# Altium schematic sheet 20_MCU_CORE.SchDoc
size 297 x 209 mm
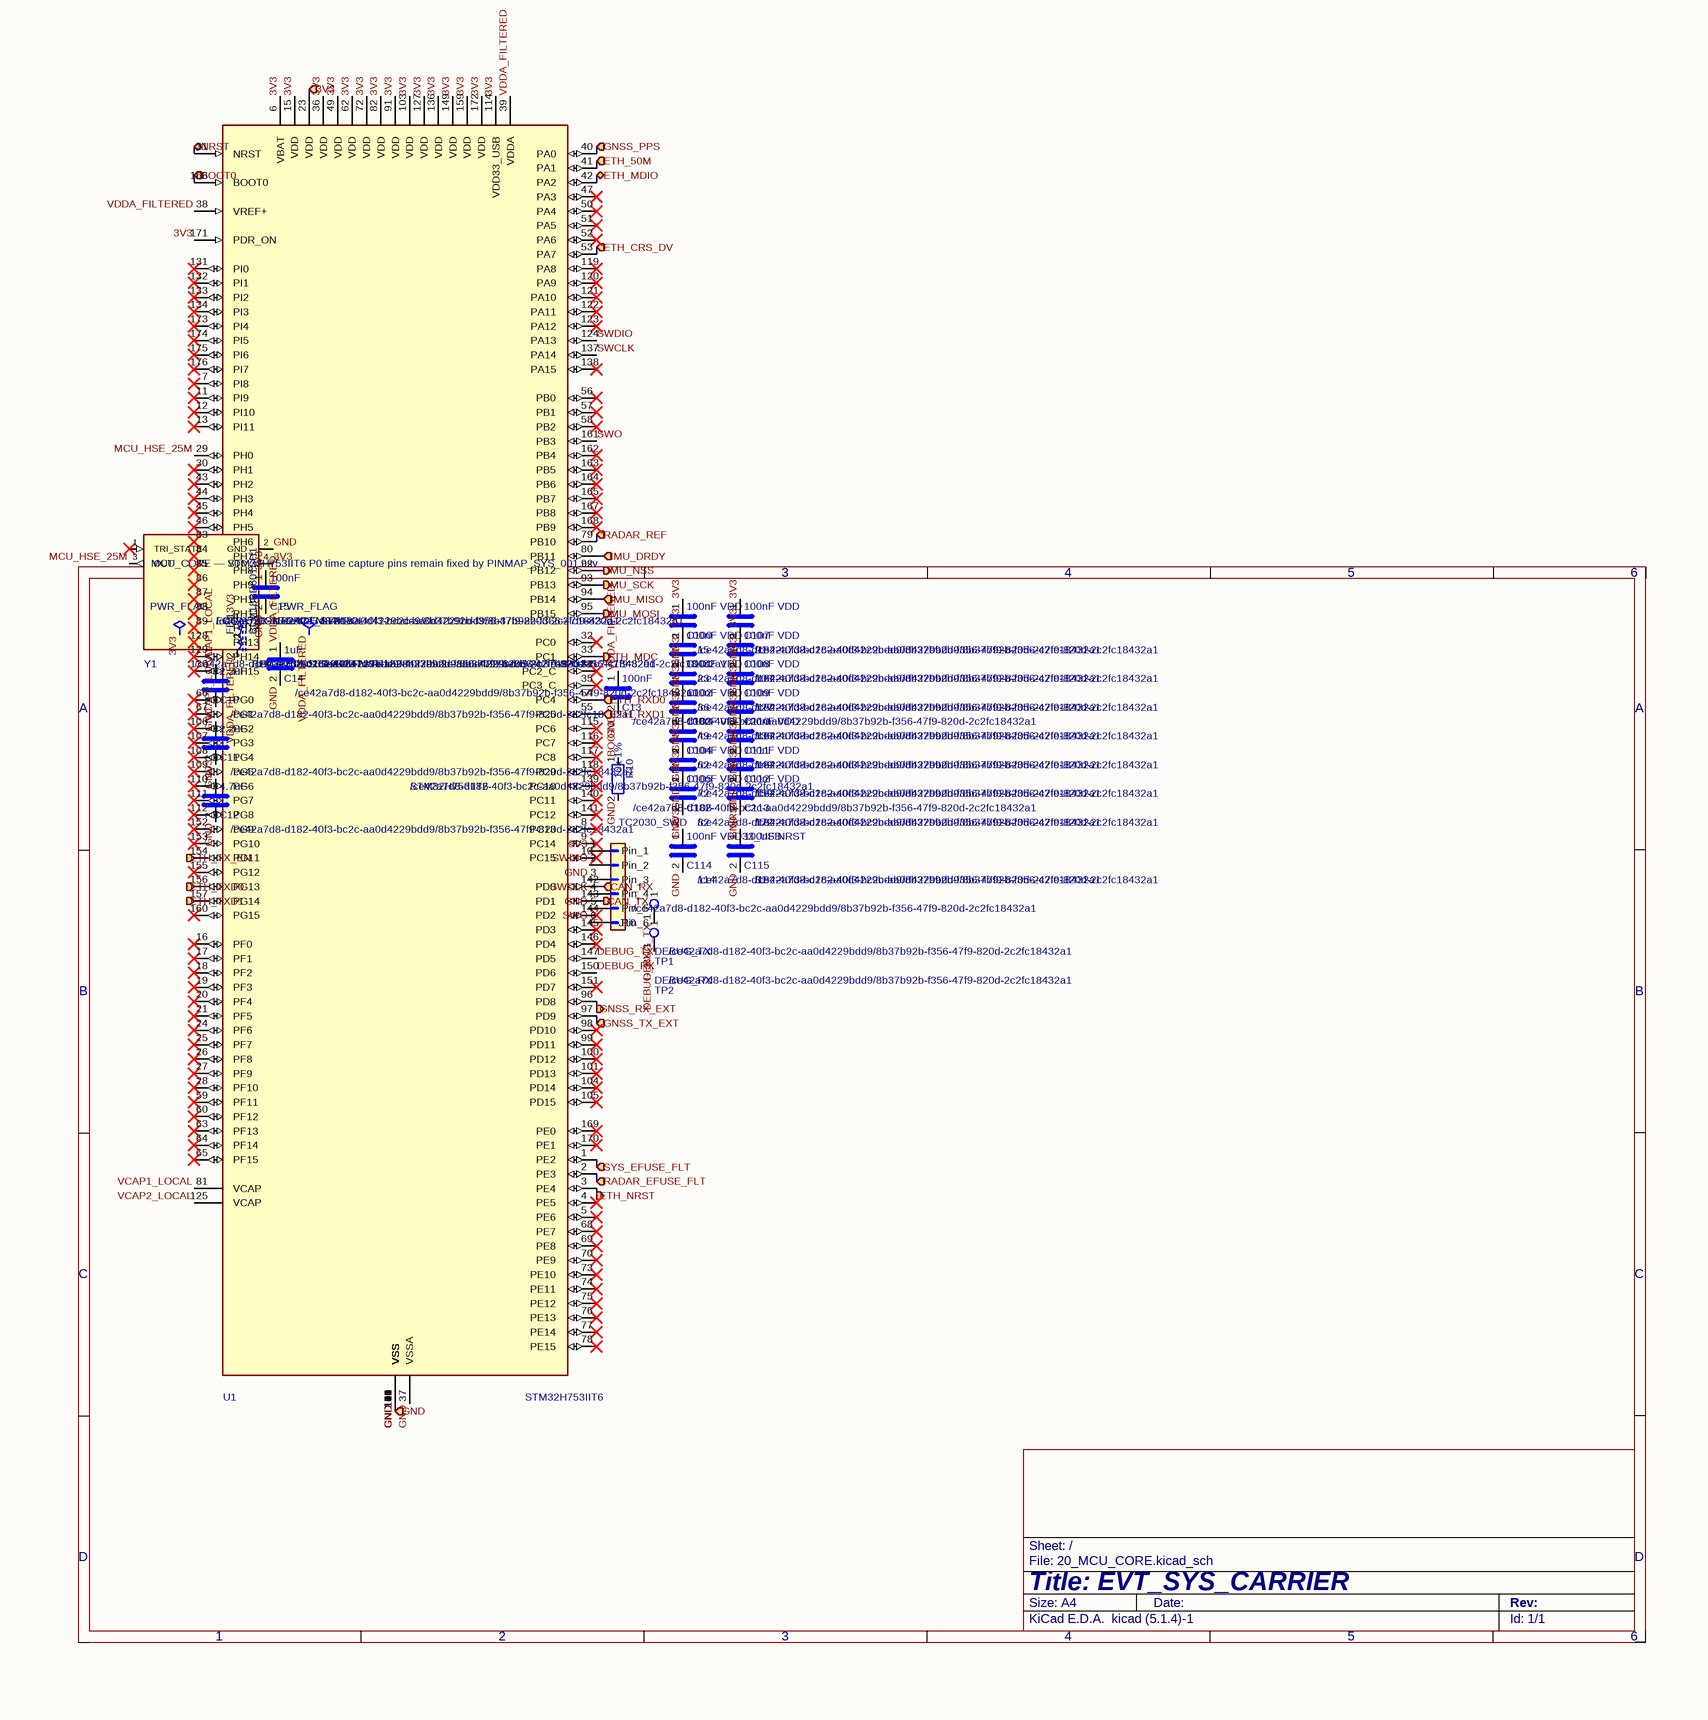
[diagram p0: 20_MCU_CORE.SchDoc]

## Parts
#FLG0101  hierarchy_path: /ce42a7d8-d182-40f3-bc2c-aa0d4229bdd9/8b37b92b-f356-47f9-820d-2c2fc18432a1  (hidden comment: PWR_FLAG)  (graphical)
#FLG0103  hierarchy_path: /ce42a7d8-d182-40f3-bc2c-aa0d4229bdd9/8b37b92b-f356-47f9-820d-2c2fc18432a1  (hidden comment: PWR_FLAG)  (graphical)
C10  hierarchy_path: /ce42a7d8-d182-40f3-bc2c-aa0d4229bdd9/8b37b92b-f356-47f9-820d-2c2fc18432a1  [C_0603_1608Metric]  (hidden comment: 2.2uF)
C11  hierarchy_path: /ce42a7d8-d182-40f3-bc2c-aa0d4229bdd9/8b37b92b-f356-47f9-820d-2c2fc18432a1  [C_0603_1608Metric]  (hidden comment: 2.2uF)
C12  hierarchy_path: /ce42a7d8-d182-40f3-bc2c-aa0d4229bdd9/8b37b92b-f356-47f9-820d-2c2fc18432a1  [C_0805_2012Metric]  (hidden comment: 4.7uF)
C13  hierarchy_path: /ce42a7d8-d182-40f3-bc2c-aa0d4229bdd9/8b37b92b-f356-47f9-820d-2c2fc18432a1  [C_0402_1005Metric]  (hidden comment: 100nF)
C14  hierarchy_path: /ce42a7d8-d182-40f3-bc2c-aa0d4229bdd9/8b37b92b-f356-47f9-820d-2c2fc18432a1  [C_0603_1608Metric]  (hidden comment: 1uF)
C15  hierarchy_path: /ce42a7d8-d182-40f3-bc2c-aa0d4229bdd9/8b37b92b-f356-47f9-820d-2c2fc18432a1  [C_0402_1005Metric]  (hidden comment: 100nF)
C100  Decouples_U1_Pin: 15  hierarchy_path: /ce42a7d8-d182-40f3-bc2c-aa0d4229bdd9/8b37b92b-f356-47f9-820d-2c2fc18432a1  [C_0402_1005Metric]  (hidden comment: 100nF VDD)
C101  Decouples_U1_Pin: 23  hierarchy_path: /ce42a7d8-d182-40f3-bc2c-aa0d4229bdd9/8b37b92b-f356-47f9-820d-2c2fc18432a1  [C_0402_1005Metric]  (hidden comment: 100nF VDD)
C102  Decouples_U1_Pin: 36  hierarchy_path: /ce42a7d8-d182-40f3-bc2c-aa0d4229bdd9/8b37b92b-f356-47f9-820d-2c2fc18432a1  [C_0402_1005Metric]  (hidden comment: 100nF VDD)
C103  Decouples_U1_Pin: 49  hierarchy_path: /ce42a7d8-d182-40f3-bc2c-aa0d4229bdd9/8b37b92b-f356-47f9-820d-2c2fc18432a1  [C_0402_1005Metric]  (hidden comment: 100nF VDD)
C104  Decouples_U1_Pin: 62  hierarchy_path: /ce42a7d8-d182-40f3-bc2c-aa0d4229bdd9/8b37b92b-f356-47f9-820d-2c2fc18432a1  [C_0402_1005Metric]  (hidden comment: 100nF VDD)
C105  Decouples_U1_Pin: 72  hierarchy_path: /ce42a7d8-d182-40f3-bc2c-aa0d4229bdd9/8b37b92b-f356-47f9-820d-2c2fc18432a1  [C_0402_1005Metric]  (hidden comment: 100nF VDD)
C106  Decouples_U1_Pin: 82  hierarchy_path: /ce42a7d8-d182-40f3-bc2c-aa0d4229bdd9/8b37b92b-f356-47f9-820d-2c2fc18432a1  [C_0402_1005Metric]  (hidden comment: 100nF VDD)
C107  Decouples_U1_Pin: 91  hierarchy_path: /ce42a7d8-d182-40f3-bc2c-aa0d4229bdd9/8b37b92b-f356-47f9-820d-2c2fc18432a1  [C_0402_1005Metric]  (hidden comment: 100nF VDD)
C108  Decouples_U1_Pin: 103  hierarchy_path: /ce42a7d8-d182-40f3-bc2c-aa0d4229bdd9/8b37b92b-f356-47f9-820d-2c2fc18432a1  [C_0402_1005Metric]  (hidden comment: 100nF VDD)
C109  Decouples_U1_Pin: 127  hierarchy_path: /ce42a7d8-d182-40f3-bc2c-aa0d4229bdd9/8b37b92b-f356-47f9-820d-2c2fc18432a1  [C_0402_1005Metric]  (hidden comment: 100nF VDD)
C110  Decouples_U1_Pin: 136  hierarchy_path: /ce42a7d8-d182-40f3-bc2c-aa0d4229bdd9/8b37b92b-f356-47f9-820d-2c2fc18432a1  [C_0402_1005Metric]  (hidden comment: 100nF VDD)
C111  Decouples_U1_Pin: 149  hierarchy_path: /ce42a7d8-d182-40f3-bc2c-aa0d4229bdd9/8b37b92b-f356-47f9-820d-2c2fc18432a1  [C_0402_1005Metric]  (hidden comment: 100nF VDD)
C112  Decouples_U1_Pin: 159  hierarchy_path: /ce42a7d8-d182-40f3-bc2c-aa0d4229bdd9/8b37b92b-f356-47f9-820d-2c2fc18432a1  [C_0402_1005Metric]  (hidden comment: 100nF VDD)
C113  Decouples_U1_Pin: 172  hierarchy_path: /ce42a7d8-d182-40f3-bc2c-aa0d4229bdd9/8b37b92b-f356-47f9-820d-2c2fc18432a1  [C_0402_1005Metric]  (hidden comment: 100nF VDD)
C114  Decouples_U1_Pin: 114  hierarchy_path: /ce42a7d8-d182-40f3-bc2c-aa0d4229bdd9/8b37b92b-f356-47f9-820d-2c2fc18432a1  [C_0402_1005Metric]  (hidden comment: 100nF VDD33_USB)
C115  Filters_U1_Pin: 31  hierarchy_path: /ce42a7d8-d182-40f3-bc2c-aa0d4229bdd9/8b37b92b-f356-47f9-820d-2c2fc18432a1  [C_0402_1005Metric]  (hidden comment: 100nF NRST)
FB1  hierarchy_path: /ce42a7d8-d182-40f3-bc2c-aa0d4229bdd9/8b37b92b-f356-47f9-820d-2c2fc18432a1  [L_0603_1608Metric]  (hidden comment: BLM18BD601SH1)
J10  hierarchy_path: /ce42a7d8-d182-40f3-bc2c-aa0d4229bdd9/8b37b92b-f356-47f9-820d-2c2fc18432a1  [TagConnect_TC2030_NL]  (hidden comment: TC2030_SWD)
R10  hierarchy_path: /ce42a7d8-d182-40f3-bc2c-aa0d4229bdd9/8b37b92b-f356-47f9-820d-2c2fc18432a1  [R_0603_1608Metric]  (hidden comment: 10k 1%)
TP1  hierarchy_path: /ce42a7d8-d182-40f3-bc2c-aa0d4229bdd9/8b37b92b-f356-47f9-820d-2c2fc18432a1  [TestPoint_Pad_D1.0mm]  (hidden comment: DEBUG_TX)
TP2  hierarchy_path: /ce42a7d8-d182-40f3-bc2c-aa0d4229bdd9/8b37b92b-f356-47f9-820d-2c2fc18432a1  [TestPoint_Pad_D1.0mm]  (hidden comment: DEBUG_RX)
U1  hierarchy_path: /ce42a7d8-d182-40f3-bc2c-aa0d4229bdd9/8b37b92b-f356-47f9-820d-2c2fc18432a1  [LQFP-176_24x24mm_P0.5mm]  (hidden comment: STM32H753IIT6)
Y1  Capture_Status: LOCAL_CONTRACT_SYMBOL  hierarchy_path: /ce42a7d8-d182-40f3-bc2c-aa0d4229bdd9/8b37b92b-f356-47f9-820d-2c2fc18432a1  [Oscillator_SMD_ECS_2520MV-xxx-xx-4Pin_2.5x2.0mm]  (hidden comment: ECS-2520S33-250-FN-TR)

## Ports
3V3 (in), BOOT0 (in), CAN_RX (in), CAN_TX (out), ETH_50M (in), ETH_CRS_DV (in), ETH_MDC (out), ETH_MDIO (bidir), ETH_NRST (out), ETH_RXD0 (in), ETH_RXD1 (in), ETH_TX_EN (out), ETH_TXD0 (out), ETH_TXD1 (out), GND, GNSS_PPS (in), GNSS_RX_EXT (out), GNSS_TX_EXT (in), IMU_DRDY (in), IMU_MISO (in), IMU_MOSI (out), IMU_NSS (out), IMU_SCK (out), NRST (bidir), RADAR_EFUSE_FLT (in), RADAR_REF (in), SYS_EFUSE_FLT (in)

## Nets
3V3: #FLG0101.1 C12.1 C15.1 C100.1 C101.1 C102.1 C103.1 C104.1 C105.1 C106.1 C107.1 C108.1 C109.1 C110.1 C111.1 C112.1 C113.1 C114.1 FB1.1 J10.1(Pin_1) U1.6(VBAT) U1.15(VDD) U1.36(VDD) U1.49(VDD) U1.62(VDD) U1.72(VDD) U1.82(VDD) U1.91(VDD) U1.103(VDD) U1.114(VDD33_USB) U1.127(VDD) U1.136(VDD) U1.149(VDD) U1.159(VDD) U1.171(PDR_ON) U1.172(VDD) Y1.4(VDD)
3V3: U1.23(VDD) ; port 3V3  [a separate net that carries the same name]
BOOT0: U1.166(BOOT0) ; port BOOT0
BOOT0: R10.1  [a separate net that carries the same name]
CAN_RX: U1.142(PD0) ; port CAN_RX
CAN_TX: U1.143(PD1) ; port CAN_TX
DEBUG_RX: TP2.1 U1.150(PD6)
DEBUG_TX: TP1.1 U1.147(PD5)
ETH_50M: U1.41(PA1) ; port ETH_50M
ETH_CRS_DV: U1.53(PA7) ; port ETH_CRS_DV
ETH_MDC: U1.33(PC1) ; port ETH_MDC
ETH_MDIO: U1.42(PA2) ; port ETH_MDIO
ETH_NRST: U1.3(PE4) ; port ETH_NRST
ETH_RXD0: U1.54(PC4) ; port ETH_RXD0
ETH_RXD1: U1.55(PC5) ; port ETH_RXD1
ETH_TX_EN: U1.154(PG11) ; port ETH_TX_EN
ETH_TXD0: U1.156(PG13) ; port ETH_TXD0
ETH_TXD1: U1.157(PG14) ; port ETH_TXD1
GND: C10.2 C11.2 C12.2 C13.2 C14.2 C15.2 C100.2 C101.2 C102.2 C103.2 C104.2 C105.2 C106.2 C107.2 C108.2 C109.2 C110.2 C111.2 C112.2 C113.2 C114.2 C115.2 J10.3(Pin_3) J10.5(Pin_5) R10.2 U1.14(VSS) U1.22(VSS) U1.37(VSSA) U1.48(VSS) U1.61(VSS) U1.71(VSS) U1.90(VSS) U1.102(VSS) U1.113(VSS) U1.126(VSS) U1.135(VSS) U1.148(VSS) U1.158(VSS) Y1.2(GND) ; port GND
GNSS_PPS: U1.40(PA0) ; port GNSS_PPS
GNSS_RX_EXT: U1.96(PD8) ; port GNSS_RX_EXT
GNSS_TX_EXT: U1.97(PD9) ; port GNSS_TX_EXT
IMU_DRDY: U1.80(PB11) ; port IMU_DRDY
IMU_MISO: U1.94(PB14) ; port IMU_MISO
IMU_MOSI: U1.95(PB15) ; port IMU_MOSI
IMU_NSS: U1.92(PB12) ; port IMU_NSS
IMU_SCK: U1.93(PB13) ; port IMU_SCK
MCU_HSE_25M: U1.29(PH0) Y1.3(OUT)
NRST: U1.31(NRST) ; port NRST
NRST: C115.1  [a separate net that carries the same name]
RADAR_EFUSE_FLT: U1.2(PE3) ; port RADAR_EFUSE_FLT
RADAR_REF: U1.79(PB10) ; port RADAR_REF
SWCLK: J10.4(Pin_4) U1.137(PA14)
SWDIO: J10.2(Pin_2) U1.124(PA13)
SWO: J10.6(Pin_6) U1.161(PB3)
SYS_EFUSE_FLT: U1.1(PE2) ; port SYS_EFUSE_FLT
VCAP1_LOCAL: C10.1 U1.81(VCAP)
VCAP2_LOCAL: C11.1 U1.125(VCAP)
VDDA_FILTERED: #FLG0103.1 C13.1 C14.1 FB1.2 U1.38(VREF+) U1.39(VDDA)

Not connected (* = marked no-connect by the designer): U1 4(PE5)* 5(PE6)* 7(PI8)* 8(PC13)* 9(PC14)* 10(PC15)* 11(PI9)* 12(PI10)* 13(PI11)* 16(PF0)* 17(PF1)* 18(PF2)* 19(PF3)* 20(PF4)* 21(PF5)* 24(PF6)* 25(PF7)* 26(PF8)* 27(PF9)* 28(PF10)* 30(PH1)* 32(PC0)* 34(PC2_C)* 35(PC3_C)* 43(PH2)* 44(PH3)* 45(PH4)* 46(PH5)* 47(PA3)* 50(PA4)* 51(PA5)* 52(PA6)* 56(PB0)* 57(PB1)* 58(PB2)* 59(PF11)* 60(PF12)* 63(PF13)* 64(PF14)* 65(PF15)* 66(PG0)* 67(PG1)* 68(PE7)* 69(PE8)* 70(PE9)* 73(PE10)* 74(PE11)* 75(PE12)* 76(PE13)* 77(PE14)* 78(PE15)* 83(PH6)* 84(PH7)* 85(PH8)* 86(PH9)* 87(PH10)* 88(PH11)* 89(PH12)* 98(PD10)* 99(PD11)* 100(PD12)* 101(PD13)* 104(PD14)* 105(PD15)* 106(PG2)* 107(PG3)* 108(PG4)* 109(PG5)* 110(PG6)* 111(PG7)* 112(PG8)* 115(PC6)* 116(PC7)* 117(PC8)* 118(PC9)* 119(PA8)* 120(PA9)* 121(PA10)* 122(PA11)* 123(PA12)* 128(PH13)* 129(PH14)* 130(PH15)* 131(PI0)* 132(PI1)* 133(PI2)* 134(PI3)* 138(PA15)* 139(PC10)* 140(PC11)* 141(PC12)* 144(PD2)* 145(PD3)* 146(PD4)* 151(PD7)* 152(PG9)* 153(PG10)* 155(PG12)* 160(PG15)* 162(PB4)* 163(PB5)* 164(PB6)* 165(PB7)* 167(PB8)* 168(PB9)* 169(PE0)* 170(PE1)* 173(PI4)* 174(PI5)* 175(PI6)* 176(PI7)*; Y1 1(TRI_STATE)*

## Notes on the sheet
- MCU_CORE — STM32H753IIT6
  P0 time capture pins remain fixed by PINMAP_SYS_001.csv
- 1
- 2
- 3
- 4
- 5
- 6
- A
- B
- C
- D
- Title: EVT_SYS_CARRIER
- File: 20_MCU_CORE.kicad_sch
- Sheet: /
- KiCad E.D.A.  kicad (5.1.4)-1
- Size: A4
- Date:
- Rev:
- Id: 1/1

## Library data of the parts
C10-C15 C100-C115 = C
  C10 C11: Value: 2.2uF; Footprint: Capacitor_SMD:C_0603_1608Metric
  C12: Value: 4.7uF; Footprint: Capacitor_SMD:C_0805_2012Metric
  C13 C15: Value: 100nF; Footprint: Capacitor_SMD:C_0402_1005Metric
  C14: Value: 1uF; Footprint: Capacitor_SMD:C_0603_1608Metric
  C100-C113: Value: 100nF VDD; Footprint: Capacitor_SMD:C_0402_1005Metric
  C114: Value: 100nF VDD33_USB; Footprint: Capacitor_SMD:C_0402_1005Metric
  C115: Value: 100nF NRST; Footprint: Capacitor_SMD:C_0402_1005Metric
FB1 = L_Ferrite: MPN: BLM18BD601SH1; Value: BLM18BD601SH1; Footprint: Inductor_SMD:L_0603_1608Metric
J10 = Conn_01x06: Value: TC2030_SWD; Footprint: SystemCarrier_Altium:TagConnect_TC2030_NL
R10 = R: Value: 10k 1%; Footprint: Resistor_SMD:R_0603_1608Metric
TP1 TP2 = TestPoint: Footprint: TestPoint:TestPoint_Pad_D1.0mm
  TP1: Value: DEBUG_TX
  TP2: Value: DEBUG_RX
U1 = STM32H753IITx: MPN: STM32H753IIT6; Value: STM32H753IIT6; Footprint: Package_QFP:LQFP-176_24x24mm_P0.5mm
#FLG0101 #FLG0103 = PWR_FLAG: Value: PWR_FLAG
Y1 = ECS-2520S33-250-FN-TR: MPN: ECS-2520S33-250-FN-TR; Value: ECS-2520S33-250-FN-TR; Footprint: Oscillator:Oscillator_SMD_ECS_2520MV-xxx-xx-4Pin_2.5x2.0mm